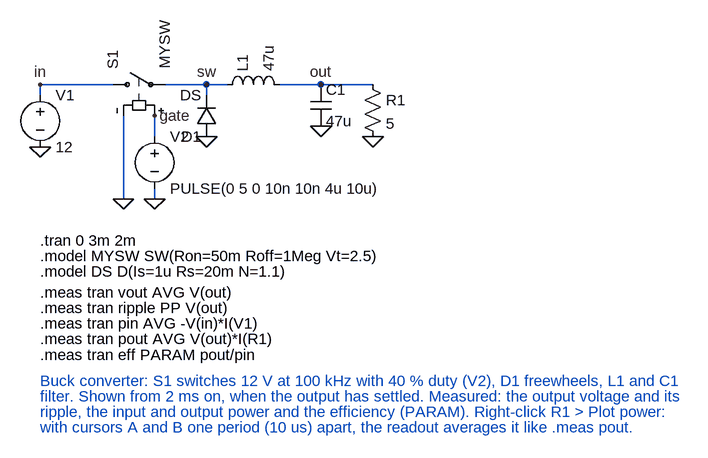
[diagram p0: schematic buck_converter.asc]
buck_converter.asc, the LTspice schematic file:
Version 4
SHEET 1 880 680
WIRE 0 96 0 80
WIRE 0 80 112 80
WIRE 192 80 256 80
WIRE 256 80 288 80
WIRE 256 80 256 96
WIRE 176 128 176 160
WIRE 128 128 128 256
WIRE 176 240 176 256
WIRE 368 80 432 80
WIRE 432 80 512 80
FLAG 0 80 in
FLAG 256 80 sw
FLAG 432 80 out
FLAG 176 128 gate
FLAG 0 176 0
FLAG 128 256 0
FLAG 176 256 0
FLAG 256 160 0
FLAG 432 144 0
FLAG 512 160 0
SYMBOL voltage 0 80 R0
SYMATTR InstName V1
SYMATTR Value 12
SYMBOL sw 96 80 R270
SYMATTR InstName S1
SYMATTR Value MYSW
SYMBOL voltage 176 144 R0
SYMATTR InstName V2
SYMATTR Value PULSE(0 5 0 10n 10n 4u 10u)
SYMBOL diode 272 160 R180
SYMATTR InstName D1
SYMATTR Value DS
SYMBOL ind 272 96 R270
SYMATTR InstName L1
SYMATTR Value 47u
SYMBOL cap 416 80 R0
SYMATTR InstName C1
SYMATTR Value 47u
SYMBOL res 496 64 R0
SYMATTR InstName R1
SYMATTR Value 5
TEXT 0 320 Left 2 !.tran 0 3m 2m
TEXT 0 344 Left 2 !.model MYSW SW(Ron=50m Roff=1Meg Vt=2.5)
TEXT 0 368 Left 2 !.model DS D(Is=1u Rs=20m N=1.1)
TEXT 0 400 Left 2 !.meas tran vout AVG V(out)
TEXT 0 424 Left 2 !.meas tran ripple PP V(out)
TEXT 0 448 Left 2 !.meas tran pin AVG -V(in)*I(V1)
TEXT 0 472 Left 2 !.meas tran pout AVG V(out)*I(R1)
TEXT 0 496 Left 2 !.meas tran eff PARAM pout/pin
TEXT 0 536 Left 2 ;Buck converter: S1 switches 12 V at 100 kHz with 40 % duty (V2), D1 freewheels, L1 and C1
TEXT 0 560 Left 2 ;filter. Shown from 2 ms on, when the output has settled. Measured: the output voltage and its
TEXT 0 584 Left 2 ;ripple, the input and output power and the efficiency (PARAM). Right-click R1 > Plot power:
TEXT 0 608 Left 2 ;with cursors A and B one period (10 us) apart, the readout averages it like .meas pout.

The netlist it stands for:
* buck_converter.asc
V1 in 0 12
S1 in sw gate 0 MYSW
V2 gate 0 PULSE(0 5 0 10n 10n 4u 10u)
D1 0 sw DS
L1 sw out 47u
C1 out 0 47u
R1 out 0 5
.model D D
.lib standard.dio
.tran 0 3m 2m
.model MYSW SW(Ron=50m Roff=1Meg Vt=2.5)
.model DS D(Is=1u Rs=20m N=1.1)
.meas tran vout AVG V(out)
.meas tran ripple PP V(out)
.meas tran pin AVG -V(in)*I(V1)
.meas tran pout AVG V(out)*I(R1)
.meas tran eff PARAM pout/pin
* Buck converter: S1 switches 12 V at 100 kHz with 40 % duty (V2), D1 freewheels, L1 and C1
* filter. Shown from 2 ms on, when the output has settled. Measured: the output voltage and its
* ripple, the input and output power and the efficiency (PARAM). Right-click R1 > Plot power:
* with cursors A and B one period (10 us) apart, the readout averages it like .meas pout.
.backanno
.end